# Altium schematic sheet Complete circuit.SchDoc
size A2; SheetNumber: 1; SheetTotal: 9
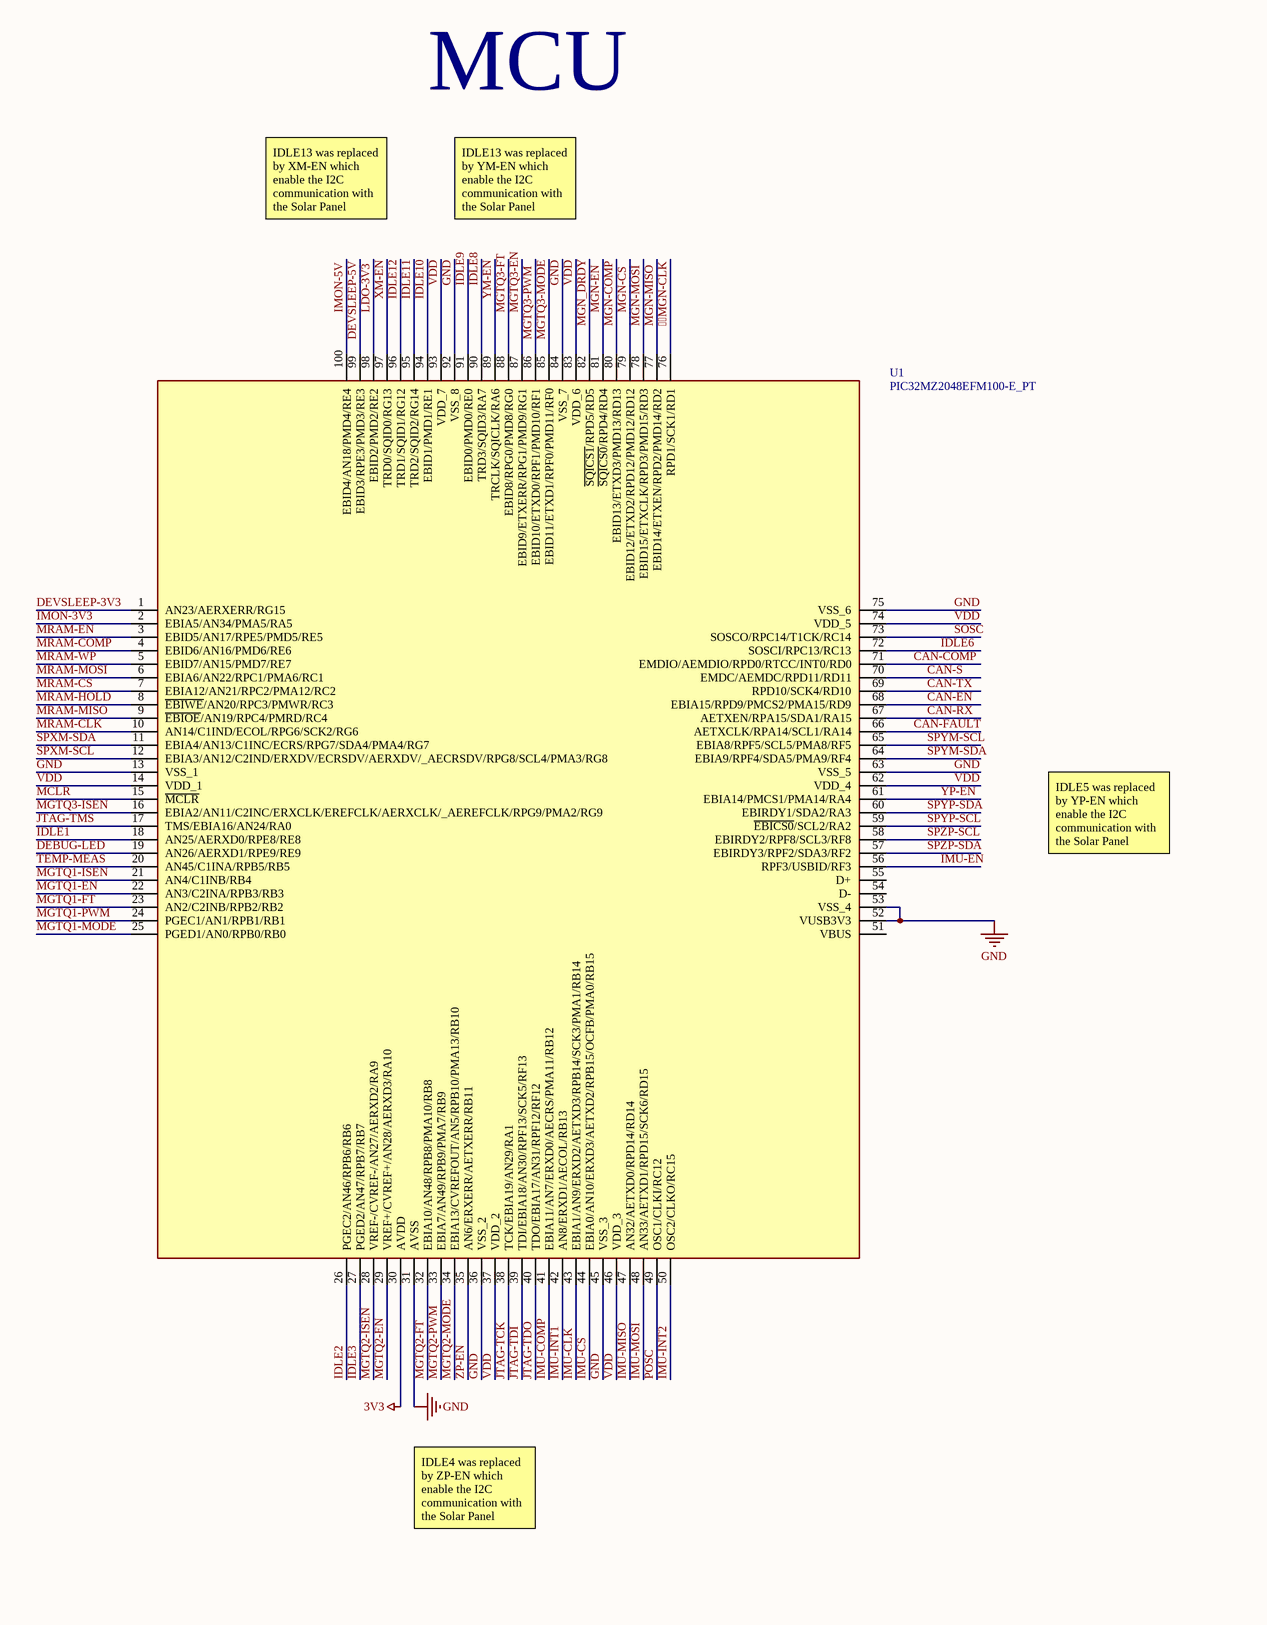
[diagram p0: Complete circuit.SchDoc, left]
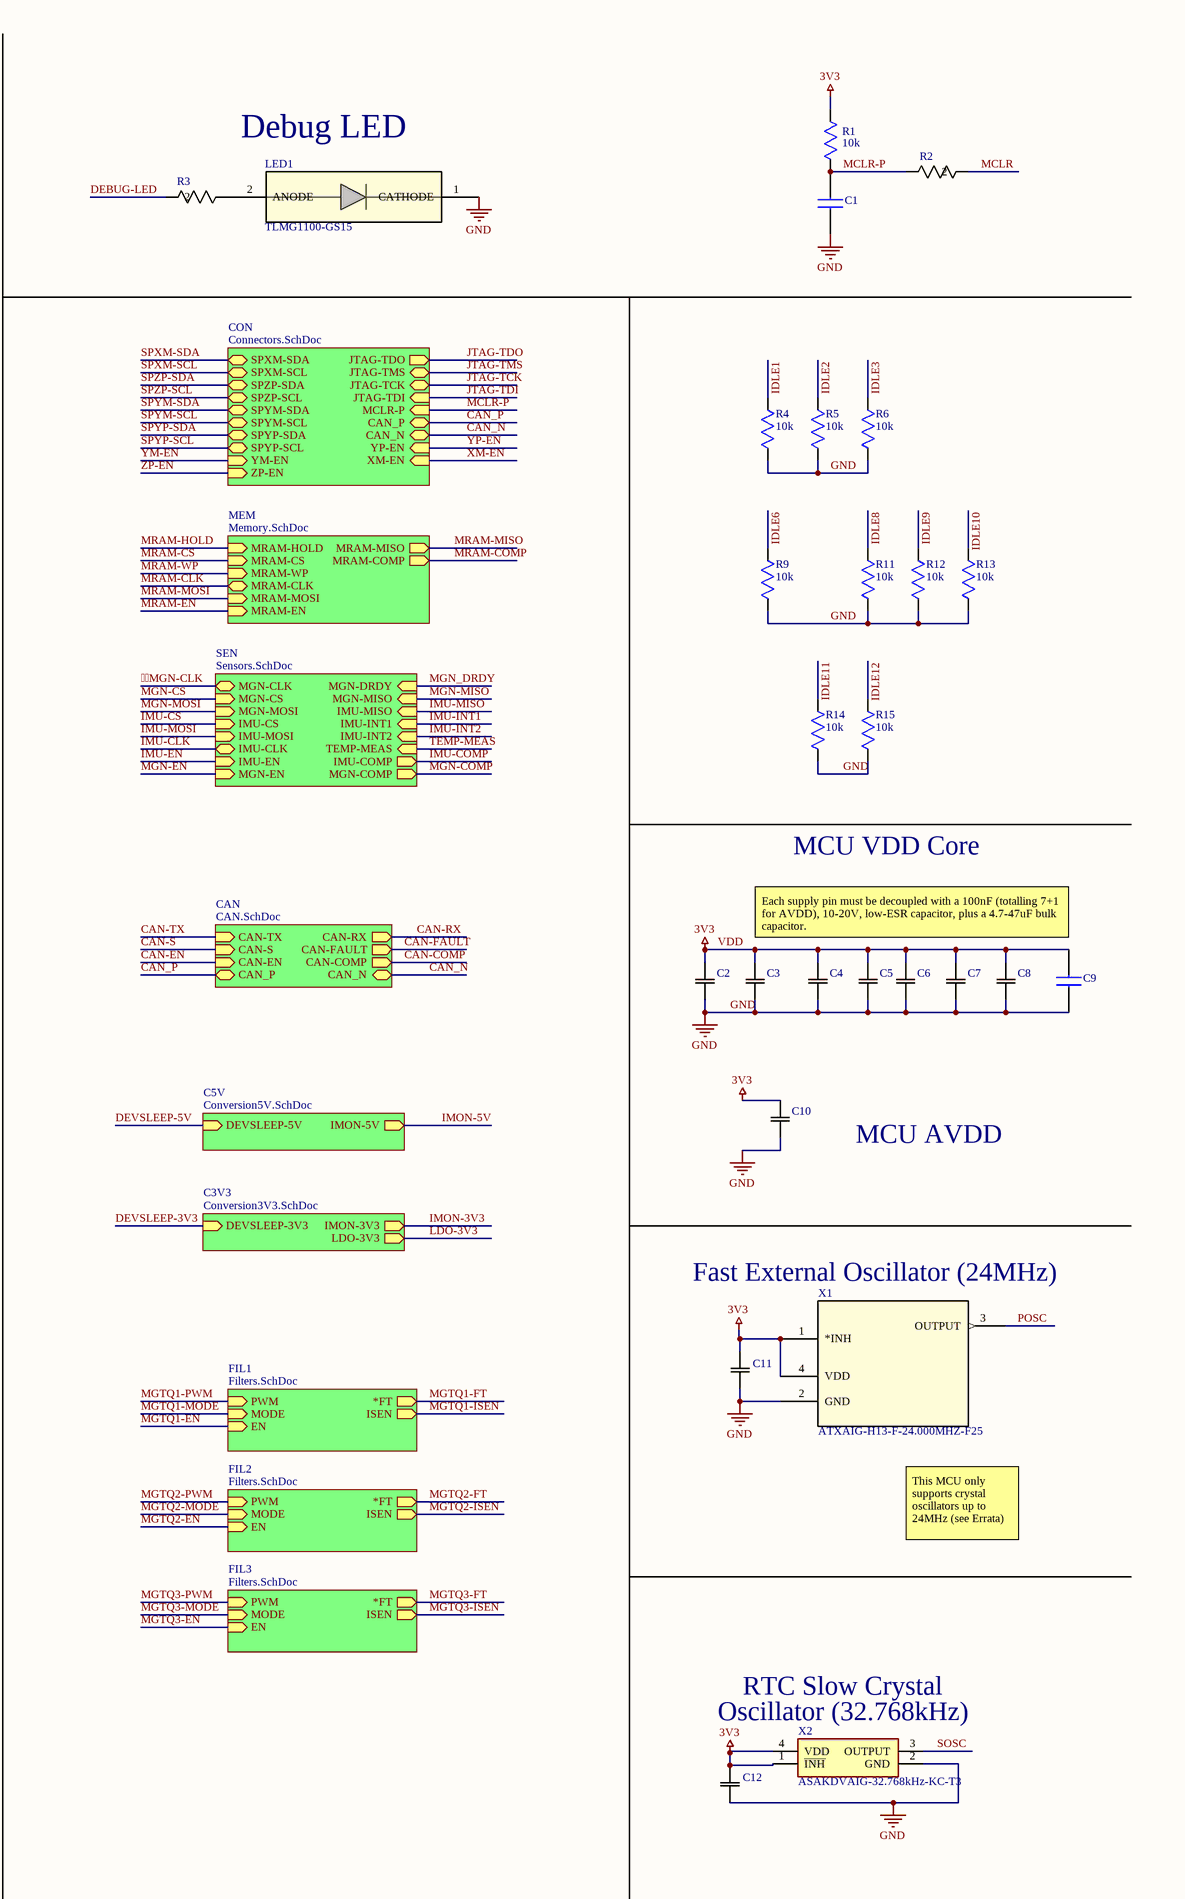
[diagram p1: Complete circuit.SchDoc, right]

## Parts
C1  C1206C104K3GACAUTO  [CAPC3216X180N]  (value not drawn)
C2  C1206C104J4GACAUTO  [CAPC340180_180N_KEM]  (value not drawn)
C3  C1206C104J4GACAUTO  [CAPC340180_180N_KEM]  (value not drawn)
C4  C1206C104J4GACAUTO  [CAPC340180_180N_KEM]  (value not drawn)
C5  C1206C104J4GACAUTO  [CAPC340180_180N_KEM]  (value not drawn)
C6  C1206C104J4GACAUTO  [CAPC340180_180N_KEM]  (value not drawn)
C7  C1206C104J4GACAUTO  [CAPC340180_180N_KEM]  (value not drawn)
C8  C1206C104J4GACAUTO  [CAPC340180_180N_KEM]  (value not drawn)
C9  C0805X106K8RACAUTO7210  [CAPC2012X145N]  (value not drawn)
C10  C1206C104J4GACAUTO  [CAPC340180_180N_KEM]  (value not drawn)
C11  C0603X103F3GACAUTO  [CAPC17795_95N_KEM]  (value not drawn)
C12  C0603X103F3GACAUTO  [CAPC17795_95N_KEM]  (value not drawn)
LED1  TLMG1100-GS15  [LED_0603_VIS]
R1  value 10k  [RES_ERA3ARB103V]  (hidden comment: ERA3ARB103V)
R2  CRCW06031K00FKEA  [RES_CRCW_0603]  (value not drawn)
R3  MCT0603MD7502BP100  [RES_MCT_0603_VIS]  (value not drawn)
R4  value 10k  [RES_ERA3ARB103V]  (hidden comment: ERA3ARB103V)
R5  value 10k  [RES_ERA3ARB103V]  (hidden comment: ERA3ARB103V)
R6  value 10k  [RES_ERA3ARB103V]  (hidden comment: ERA3ARB103V)
R9  value 10k  [RES_ERA3ARB103V]  (hidden comment: ERA3ARB103V)
R11  value 10k  [RES_ERA3ARB103V]  (hidden comment: ERA3ARB103V)
R12  value 10k  [RES_ERA3ARB103V]  (hidden comment: ERA3ARB103V)
R13  value 10k  [RES_ERA3ARB103V]  (hidden comment: ERA3ARB103V)
R14  value 10k  [RES_ERA3ARB103V]  (hidden comment: ERA3ARB103V)
R15  value 10k  [RES_ERA3ARB103V]  (hidden comment: ERA3ARB103V)
U1  PIC32MZ2048EFM100-E_PT  [QFP40P1400X1400X120-100N]
X1  ATXAIG-H13-F-24.000MHZ-F25  [OSC4_ATXAIG-H13_ABR]
X2  ASAKDVAIG-32.768kHz-KC-T3  [ASAKDVAIG32768kHzKCT3]

## Sub-sheets
C3V3 = Conversion3V3.SchDoc: DEVSLEEP-3V3 (in), IMON-3V3 (out), LDO-3V3 (out)
C5V = Conversion5V.SchDoc: DEVSLEEP-5V (in), IMON-5V (out)
CAN = CAN.SchDoc: CAN-RX (out), CAN-FAULT (out), CAN-COMP (out), CAN-TX (in), CAN-S (in), CAN-EN (in), CAN_P (bidir), CAN_N (bidir)
CON = Connectors.SchDoc: SPXM-SDA (bidir), SPXM-SCL (bidir), SPZP-SDA (bidir), SPZP-SCL (bidir), SPYM-SDA (bidir), SPYM-SCL (bidir), SPYP-SDA (bidir), SPYP-SCL (bidir), JTAG-TDO (out), JTAG-TMS (bidir), JTAG-TCK (bidir), JTAG-TDI (in), MCLR-P (in), CAN_P (bidir), CAN_N (bidir), YP-EN (in), YM-EN (in), XM-EN (in), ZP-EN (in)
FIL1 = Filters.SchDoc: PWM (in), MODE (in), *FT (out), EN (in), ISEN (out)
FIL2 = Filters.SchDoc: PWM (in), MODE (in), *FT (out), EN (in), ISEN (out)
FIL3 = Filters.SchDoc: PWM (in), MODE (in), *FT (out), EN (in), ISEN (out)
MEM = Memory.SchDoc: MRAM-HOLD (in), MRAM-CS (in), MRAM-WP (in), MRAM-CLK (bidir), MRAM-MISO (out), MRAM-MOSI (in), MRAM-EN (in), MRAM-COMP (out)
SEN = Sensors.SchDoc: MGN-DRDY (in), MGN-CLK (bidir), MGN-MISO (in), MGN-CS (in), MGN-MOSI (in), IMU-MISO (in), IMU-CS (in), IMU-INT1 (in), IMU-MOSI (in), IMU-INT2 (in), IMU-CLK (bidir), TEMP-MEAS (in), IMU-EN (in), IMU-COMP (out), MGN-EN (in), MGN-COMP (out)

## Nets
GND: C1.2 C2.1 C3.1 C4.1 C5.1 C6.1 C7.1 C8.1 C9.1 C10.1 C11.1 C12.1 LED1.1(CATHODE) R4.1 R5.1 R6.1 R9.1 R11.1 R12.1 R13.1 R14.1 R15.1 U1.13(VSS_1) U1.31(AVSS) U1.36(VSS_2) U1.45(VSS_3) U1.52(VUSB3V3) U1.53(VSS_4) U1.63(VSS_5) U1.75(VSS_6) U1.84(VSS_7) U1.92(VSS_8) X1.2(GND) X2.2(GND)
VDD: C2.2 C3.2 C4.2 C5.2 C6.2 C7.2 C8.2 C9.2 C10.2 C11.2 C12.2 R1.2 U1.14(VDD_1) U1.30(AVDD) U1.37(VDD_2) U1.46(VDD_3) U1.62(VDD_4) U1.74(VDD_5) U1.83(VDD_6) U1.93(VDD_7) X1.1(*INH) X1.4(VDD) X2.1(~{INH}) X2.4(VDD)  [also labelled 3V3]
MGN-CLK: U1.76(RPD1/SCK1/RD1) ; sheet SEN/MGN-CLK
CAN-COMP: U1.71(EMDIO/AEMDIO/RPD0/RTCC/INT0/RD0) ; sheet CAN/CAN-COMP
CAN-EN: U1.68(EBIA15/RPD9/PMCS2/PMA15/RD9) ; sheet CAN/CAN-EN
CAN-FAULT: U1.66(AETXCLK/RPA14/SCL1/RA14) ; sheet CAN/CAN-FAULT
CAN-RX: U1.67(AETXEN/RPA15/SDA1/RA15) ; sheet CAN/CAN-RX
CAN-S: U1.70(EMDC/AEMDC/RPD11/RD11) ; sheet CAN/CAN-S
CAN-TX: U1.69(RPD10/SCK4/RD10) ; sheet CAN/CAN-TX
CAN_N: sheet CAN/CAN_N, sheet CON/CAN_N
CAN_P: sheet CAN/CAN_P, sheet CON/CAN_P
DEBUG-LED: R3.2 U1.19(AN26/AERXD1/RPE9/RE9)
DEVSLEEP-3V3: U1.1(AN23/AERXERR/RG15) ; sheet C3V3/DEVSLEEP-3V3
DEVSLEEP-5V: U1.99(EBID3/RPE3/PMD3/RE3) ; sheet C5V/DEVSLEEP-5V
IDLE1: R4.2 U1.18(AN25/AERXD0/RPE8/RE8)
IDLE2: R5.2 U1.26(PGEC2/AN46/RPB6/RB6)
IDLE3: R6.2 U1.27(PGED2/AN47/RPB7/RB7)
IDLE6: R9.2 U1.72(SOSCI/RPC13/RC13)
IDLE8: R11.2 U1.90(TRD3/SQID3/RA7)
IDLE9: R12.2 U1.91(EBID0/PMD0/RE0)
IDLE10: R13.2 U1.94(EBID1/PMD1/RE1)
IDLE11: R14.2 U1.95(TRD2/SQID2/RG14)
IDLE12: R15.2 U1.96(TRD1/SQID1/RG12)
IMON-3V3: U1.2(EBIA5/AN34/PMA5/RA5) ; sheet C3V3/IMON-3V3
IMON-5V: U1.100(EBID4/AN18/PMD4/RE4) ; sheet C5V/IMON-5V
IMU-CLK: U1.43(EBIA1/AN9/ERXD2/AETXD3/RPB14/SCK3/PMA1/RB14) ; sheet SEN/IMU-CLK
IMU-COMP: U1.41(EBIA11/AN7/ERXD0/AECRS/PMA11/RB12) ; sheet SEN/IMU-COMP
IMU-CS: U1.44(EBIA0/AN10/ERXD3/AETXD2/RPB15/OCFB/PMA0/RB15) ; sheet SEN/IMU-CS
IMU-EN: U1.56(RPF3/USBID/RF3) ; sheet SEN/IMU-EN
IMU-INT1: U1.42(AN8/ERXD1/AECOL/RB13) ; sheet SEN/IMU-INT1
IMU-INT2: U1.50(OSC2/CLKO/RC15) ; sheet SEN/IMU-INT2
IMU-MISO: U1.47(AN32/AETXD0/RPD14/RD14) ; sheet SEN/IMU-MISO
IMU-MOSI: U1.48(AN33/AETXD1/RPD15/SCK6/RD15) ; sheet SEN/IMU-MOSI
JTAG-TCK: U1.38(TCK/EBIA19/AN29/RA1) ; sheet CON/JTAG-TCK
JTAG-TDI: U1.39(TDI/EBIA18/AN30/RPF13/SCK5/RF13) ; sheet CON/JTAG-TDI
JTAG-TDO: U1.40(TDO/EBIA17/AN31/RPF12/RF12) ; sheet CON/JTAG-TDO
JTAG-TMS: U1.17(TMS/EBIA16/AN24/RA0) ; sheet CON/JTAG-TMS
LDO-3V3: U1.98(EBID2/PMD2/RE2) ; sheet C3V3/LDO-3V3
MCLR: R2.2 U1.15(~{MCLR})
MCLR-P: C1.1 R1.1 R2.1 ; sheet CON/MCLR-P
MGN-COMP: U1.80(EBID13/ETXD3/PMD13/RD13) ; sheet SEN/MGN-COMP
MGN-CS: U1.79(EBID12/ETXD2/RPD12/PMD12/RD12) ; sheet SEN/MGN-CS
MGN-EN: U1.81(~{SQICS0}/RPD4/RD4) ; sheet SEN/MGN-EN
MGN-MISO: U1.77(EBID14/ETXEN/RPD2/PMD14/RD2) ; sheet SEN/MGN-MISO
MGN-MOSI: U1.78(EBID15/ETXCLK/RPD3/PMD15/RD3) ; sheet SEN/MGN-MOSI
MGN_DRDY: U1.82(~{SQICS1}/RPD5/RD5) ; sheet SEN/MGN-DRDY
MGTQ1-EN: U1.22(AN3/C2INA/RPB3/RB3) ; sheet FIL1/EN
MGTQ1-FT: U1.23(AN2/C2INB/RPB2/RB2) ; sheet FIL1/*FT
MGTQ1-ISEN: U1.21(AN4/C1INB/RB4) ; sheet FIL1/ISEN
MGTQ1-MODE: U1.25(PGED1/AN0/RPB0/RB0) ; sheet FIL1/MODE
MGTQ1-PWM: U1.24(PGEC1/AN1/RPB1/RB1) ; sheet FIL1/PWM
MGTQ2-EN: U1.29(VREF+/CVREF+/AN28/AERXD3/RA10) ; sheet FIL2/EN
MGTQ2-FT: U1.32(EBIA10/AN48/RPB8/PMA10/RB8) ; sheet FIL2/*FT
MGTQ2-ISEN: U1.28(VREF-/CVREF-/AN27/AERXD2/RA9) ; sheet FIL2/ISEN
MGTQ2-MODE: U1.34(EBIA13/CVREFOUT/AN5/RPB10/PMA13/RB10) ; sheet FIL2/MODE
MGTQ2-PWM: U1.33(EBIA7/AN49/RPB9/PMA7/RB9) ; sheet FIL2/PWM
MGTQ3-EN: U1.87(EBID9/ETXERR/RPG1/PMD9/RG1) ; sheet FIL3/EN
MGTQ3-FT: U1.88(EBID8/RPG0/PMD8/RG0) ; sheet FIL3/*FT
MGTQ3-ISEN: U1.16(EBIA2/AN11/C2INC/ERXCLK/EREFCLK/AERXCLK/_AEREFCLK/RPG9/PMA2/RG9) ; sheet FIL3/ISEN
MGTQ3-MODE: U1.85(EBID11/ETXD1/RPF0/PMD11/RF0) ; sheet FIL3/MODE
MGTQ3-PWM: U1.86(EBID10/ETXD0/RPF1/PMD10/RF1) ; sheet FIL3/PWM
MRAM-CLK: U1.10(AN14/C1IND/ECOL/RPG6/SCK2/RG6) ; sheet MEM/MRAM-CLK
MRAM-COMP: U1.4(EBID6/AN16/PMD6/RE6) ; sheet MEM/MRAM-COMP
MRAM-CS: U1.7(EBIA12/AN21/RPC2/PMA12/RC2) ; sheet MEM/MRAM-CS
MRAM-EN: U1.3(EBID5/AN17/RPE5/PMD5/RE5) ; sheet MEM/MRAM-EN
MRAM-HOLD: U1.8(~{EBIWE}/AN20/RPC3/PMWR/RC3) ; sheet MEM/MRAM-HOLD
MRAM-MISO: U1.9(~{EBIOE}/AN19/RPC4/PMRD/RC4) ; sheet MEM/MRAM-MISO
MRAM-MOSI: U1.6(EBIA6/AN22/RPC1/PMA6/RC1) ; sheet MEM/MRAM-MOSI
MRAM-WP: U1.5(EBID7/AN15/PMD7/RE7) ; sheet MEM/MRAM-WP
POSC: U1.49(OSC1/CLKI/RC12) X1.3(OUTPUT)
SOSC: U1.73(SOSCO/RPC14/T1CK/RC14) X2.3(OUTPUT)
SPXM-SCL: U1.12(EBIA3/AN12/C2IND/ERXDV/ECRSDV/AERXDV/_AECRSDV/RPG8/SCL4/PMA3/RG8) ; sheet CON/SPXM-SCL
SPXM-SDA: U1.11(EBIA4/AN13/C1INC/ECRS/RPG7/SDA4/PMA4/RG7) ; sheet CON/SPXM-SDA
SPYM-SCL: U1.65(EBIA8/RPF5/SCL5/PMA8/RF5) ; sheet CON/SPYM-SCL
SPYM-SDA: U1.64(EBIA9/RPF4/SDA5/PMA9/RF4) ; sheet CON/SPYM-SDA
SPYP-SCL: U1.59(~{EBICS0}/SCL2/RA2) ; sheet CON/SPYP-SCL
SPYP-SDA: U1.60(EBIRDY1/SDA2/RA3) ; sheet CON/SPYP-SDA
SPZP-SCL: U1.58(EBIRDY2/RPF8/SCL3/RF8) ; sheet CON/SPZP-SCL
SPZP-SDA: U1.57(EBIRDY3/RPF2/SDA3/RF2) ; sheet CON/SPZP-SDA
TEMP-MEAS: U1.20(AN45/C1INA/RPB5/RB5) ; sheet SEN/TEMP-MEAS
XM-EN: U1.97(TRD0/SQID0/RG13) ; sheet CON/XM-EN
YM-EN: U1.89(TRCLK/SQICLK/RA6) ; sheet CON/YM-EN
YP-EN: U1.61(EBIA14/PMCS1/PMA14/RA4) ; sheet CON/YP-EN
ZP-EN: U1.35(AN6/ERXERR/AETXERR/RB11) ; sheet CON/ZP-EN
NetLED1_2: LED1.2(ANODE) R3.1

Not connected (* = marked no-connect by the designer): U1 51(VBUS) 54(D-) 55(D+)

## Notes on the sheet
- Debug LED
- MCU
- IDLE13 was replaced by XM-EN which enable the I2C communication with the Solar Panel
- IDLE13 was replaced by YM-EN which enable the I2C communication with the Solar Panel
- IDLE5 was replaced by YP-EN which enable the I2C communication with the Solar Panel
- MCU VDD Core
- Each supply pin must be decoupled with a 100nF (totalling 7+1 for AVDD), 10-20V, low-ESR capacitor, plus a 4.7-47uF bulk capacitor.
- MCU AVDD
- (near X1) Fast External Oscillator (24MHz)
- IDLE4 was replaced by ZP-EN which enable the I2C communication with the Solar Panel
- This MCU only supports crystal oscillators up to 24MHz (see Errata)
- (near X2) Oscillator (32.768kHz)
- RTC Slow Crystal

## Library data of the parts
C1 = CMP-001-00115-2: SMD Auto C0G, Ceramic, 0.1 uF, 10%, 25 VDC, 62.5 VDC, 125C, -55C, C0G, SMD, MLCC, Ultra-Stable, Low Loss, Automotive Grade, 0.1 % , 10 GOhms, 36 mg, 1206, 3.2mm, 1.6mm, 1.6mm, 0.5mm, 2000, 78  Weeks, 120; Manufacturer_Name: KEMET; Geometry.Height: 1.8mm; Datasheet Link: https://content.kemet.com/datasheets/KEM_C1022_C0G_AUTO_SMD.pdf; Design Item ID: C1206C104K3GACAUTO; Manufacturer_Part_Number: C1206C104K3GACAUTO; Mouser Part Number: 80-C1206C104K3GAUTO; Mouser Price/Stock: https://www.mouser.co.uk/ProductDetail/KEMET/C1206C104K3GACAUTO?qs=iLbezkQI%252BsiL409OZdKKSA%3D%3D; Source: C1206C104K3GACAUTO.SchLib
C2-C8 C10 = CMP-001-00131-4: SMD Auto C0G, Ceramic, 0.1 uF, 5%, 16 VDC, C0G, SMD, MLCC, Ultra-Stable, Low Loss, Automotive Grade, 1206; Manufacturer_Name: Kemet; Copyright: Copyright (C) 2025 Ultra Librarian. All rights reserved.; Manufacturer_Part_Number: C1206C104J4GACAUTO; Source: C1206C104J4GACAUTO.SchLib; Design Item ID: C1206C104J4GACAUTO
C9 = CMP-001-00121-2: SMD Auto X7R Flex, Ceramic, 10 uF, 10%, 10 VDC, 25 VDC, 125C, -55C, X7R, SMD, MLCC, FT-CAP, Automotive Grade, 10 % , 10 MOhms, 21 mg, 0805, 2mm, 1.25mm, 1.25mm, 0.75mm, 0.5mm, 10000, 78  Weeks, 80; Manufacturer_Name: YAGEO; Geometry.Height: 1.45mm; Capacitance: 10uF; Mouser Price/Stock: https://www.mouser.co.uk/ProductDetail/KEMET/C0805X106K8RACAUTO7210?qs=HXFqYaX1Q2whBpVr4Bdd3g%3D%3D; Mouser Part Number: 80-C0805X106K8RAUTLR; Source: C0805X106K8RACAUTO7210.SchLib; Design Item ID: C0805X106K8RACAUTO7210; Datasheet Link: https://content.kemet.com/datasheets/KEM_C1078_X7R_FT-CAP_AUTO_SMD.pdf; Manufacturer_Part_Number: C0805X106K8RACAUTO7210
C11 C12 = CMP-001-00116-2: SMD Auto C0G Flex, Ceramic, 0.01 uF, 1%, 25 VDC, C0G, SMD, MLCC, FT-CAP, Ultra-Stable, Automotive Grade, 0603; Manufacturer_Name: Kemet; Copyright: Copyright (C) 2025 Ultra Librarian. All rights reserved.; Design Item ID: C0603X103F3GACAUTO; Manufacturer_Part_Number: C0603X103F3GACAUTO; Source: C0603X103F3GACAUTO.SchLib
LED1 = CMP-007-00036-1: CHIPLED(SMD 0603-LED) GREEN U.BRIGHT-e4; Manufacturer_Name: Vishay; RefDes: RefDes; Copyright: Copyright (C) 2025 Ultra Librarian. All rights reserved.; Type: Type; Design Item ID: TLMG1100-GS15; Manufacturer_Part_Number: TLMG1100-GS15; Source: TLMG1100-GS15.SchLib
R1 R4-R6 R9 R11-R15 = CMP-009-00245-3: Thin Film Resistors - SMD 0603 10Kohm 0.1% 10ppm AEC-Q200; Design Item ID: ERA3ARB103V; Case/Package: None; Pins: 2; Source: ERA3ARB103V.SchLib; Component Type: Standard; MP: ERA3ARB103V; Availability: Unavailable; Price: None
R2 = CMP-009-00227-2: D11/CRCW0603 100 1K 1% ET1 e3; Manufacturer_Name: Vishay; Source: CRCW06031K00FKEA.SchLib; Copyright: Copyright (C) 2026 Ultra Librarian. All rights reserved.; Design Item ID: CRCW06031K00FKEA; Manufacturer_Part_Number: CRCW06031K00FKEA
R3 = CMP-009-00216-2: MCT 0603-25 0.1% AT P1 75K; Manufacturer_Name: Vishay; Source: MCT0603MD7502BP100.SchLib; Copyright: Copyright (C) 2025 Ultra Librarian. All rights reserved.; Design Item ID: MCT0603MD7502BP100; Manufacturer_Part_Number: MCT0603MD7502BP100
U1 = CMP-481-000000-2: 32-bit Microcontrollers - MCU 32-Bit MCU 2048KB FL 512KB RAM Crypto; Manufacturer_Part_Number: PIC32MZ2048EFM100-E/PT; Manufacturer_Name: Microchip; Geometry.Height: 1.2mm; Source: PIC32MZ2048EFM100-E_PT.SchLib; Mouser Part Number: 579-MZ2048EFM100EPT; Design Item ID: PIC32MZ2048EFM100-E_PT; Datasheet Link: https://componentsearchengine.com/Datasheets/1/PIC32MZ2048EFM100-E_PT.pdf; Mouser Price/Stock: https://www.mouser.co.uk/ProductDetail/Microchip-Technology/PIC32MZ2048EFM100-E-PT?qs=r%2FmwOkjQ8utAqJN2CglPVg%3D%3D
X1 = CMP-337-000000-2: 24 MHz TCXO CMOS Oscillator 1.68V ~ 3.63V Enable/Disable 4-SMD, No Lead; Manufacturer_Name: Abracon; Copyright: Copyright (C) 2026 Ultra Librarian. All rights reserved.; Manufacturer_Part_Number: ATXAIG-H13-F-40.000MHZ-F25; RefDes: RefDes; Source: ATXAIG-H13-F-40P000MHZ-F25.SchLib; Type: Oscillators; Design Item ID: ATXAIG-H13-F-40.000MHZ-F25
X2 = CMP-003-00035-1: XTAL OSC XO Continuous Volt kHz Automotive; Manufacturer_Name: ABRACON; Geometry.Height: 0.8mm; Datasheet Link: https://abracon.com/datasheets/ASAKDVAIG.pdf; Manufacturer_Part_Number: ASAKDVAIG-32.768kHz-KC-T3; Design Item ID: ASAKDVAIG-32.768kHz-KC-T3; Mouser Part Number: 815-AKDVAIG32768KCT3; Source: ASAKDVAIG-32.768kHz-KC-T3.SchLib; Mouser Price/Stock: https://www.mouser.co.uk/ProductDetail/ABRACON/ASAKDVAIG-32.768kHz-KC-T3?qs=vvQtp7zwQdM6CQP0VQ4oog%3D%3D